# Altium schematic sheet power.SchDoc: Наименование
size 420 x 297 mm; ApprovedBy: Утвердил; CheckedBy: Проверил; Author: Разработал; CompanyName: ВлГУ; DrawnBy: Н.Контр; Engineer: Т.Контр; SheetNumber: 8; SheetTotal: 9; PageSetup: Record=PageOptions|CenterHorizontal=True|CenterVertical=True|PrintScale=0.94|XCorrection=1.00|YCorrection=1.00|PrintKind=1|BorderSize=5000000|LeftOffset=0|BottomOffset=0|Orientation=1|PaperLength=1000|PaperWidth=1000|Scale=100|PaperSource=7|PrintQuality=-4|MediaType=1|DitherType=10|PaperKind=A4|PrintScaleMode=1; DecimalNumber: Децимальный номер; HeadOfSector: Нач. сектора; MainDevice: Перв.примен.; Name: Наименование; DocumentName: Sheet1.SCHDOC
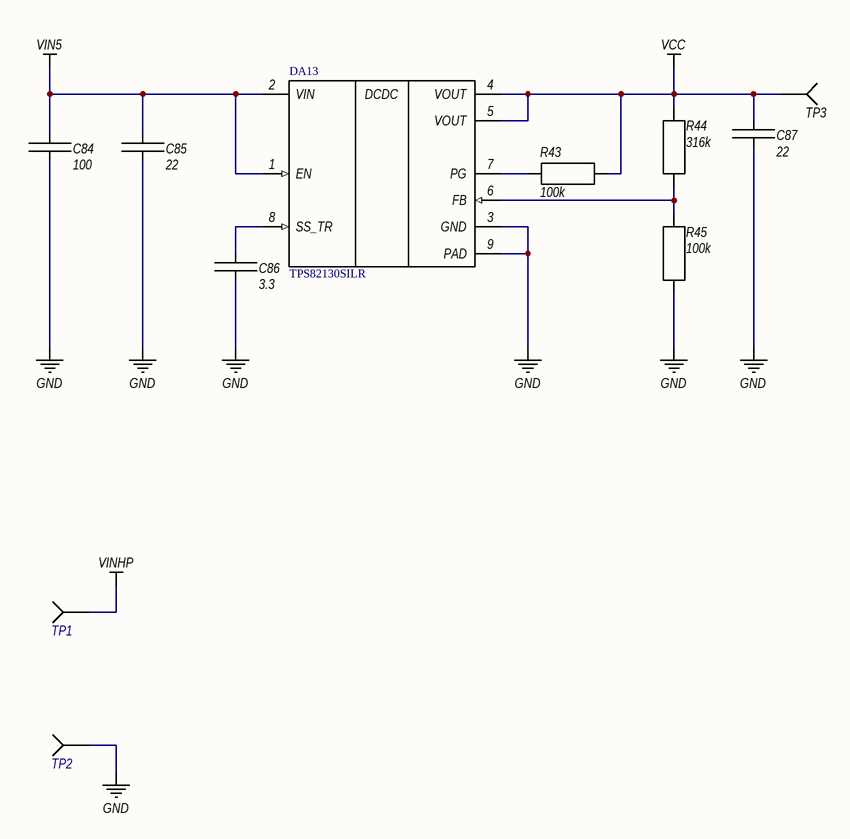
[diagram p0: power.SchDoc]

## Parts
C84  100  [C1206C]
C85  22  [C0805C]
C86  3.3  [C0805C]
C87  22  [C0805C]
DA13  TPS82130SILR  [SIL0008D_SMD]
R43  100k  [C0805R]
R44  316k  [C0805R]
R45  100k  [C0805R]
TP1  (no value)  [TestPoint]  (no BOM)
TP2  (no value)  [TestPoint]  (no BOM)
TP3  (no value)  [TestPoint]  (no BOM)

## Nets
GND: C84.2 C85.2 C86.2 C87.2 DA13.3(GND) DA13.9(PAD) R45.2 TP2.1
VCC: C87.1 DA13.4(VOUT) DA13.5(VOUT) R43.1 R44.2 TP3.1
VIN5: C84.1 C85.1 DA13.1(EN) DA13.2(VIN)
VINHP: TP1.1
NetC86_1: C86.1 DA13.8(SS_TR)
NetDA13_6: DA13.6(FB) R44.1 R45.1
NetDA13_7: DA13.7(PG) R43.2

## Notes on the sheet
- Подп. и дата
- Инв.№ дубл.
- Взам.инв.№
- Подп.и дата
- Инв.№ подл.
- Изм.
- Лист
- № докум.
- Подп.
- Дата
- Формат  A3
- (in symbol TPS82130SILR) DCDC

## Library data of the parts
C84 = Cap: Part number: GRM31CR60J107ME39L; Value: 100
C85-C87 = Cap
  C85 C87: Value: 22
  C86: Value: 3.3
DA13 = TPS82130SILR: 17-V input 3-A step-down converter module with integrated inductor 8-uSiP -40 to 125; Manufacturer_Name: Texas Instruments; TYPE: TYPE; RefDes: RefDes; Copyright: Copyright (C) 2025 Ultra Librarian. All rights reserved.; Manufacturer_Part_Number: TPS82130SILR; Datasheet: https://www.ti.com/lit/gpn/tps82130
R43-R45 = res
  R43 R45: Value: 100k
  R44: Value: 316k
TP1-TP3 = TestPoint